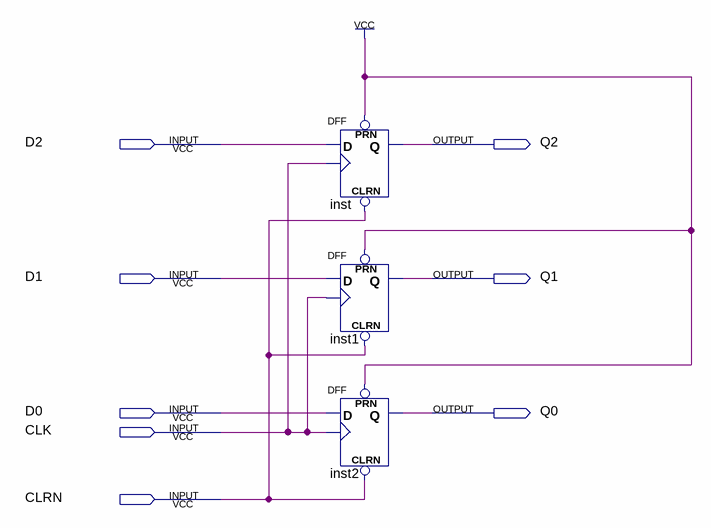
[diagram p0: schematic sheet]
// Quartus schematic block16.bdf as structural Verilog: 3 symbols, 8 pins
module block16 (
  input  D2,
  input  D1,
  input  D0,
  input  CLK,
  input  CLRN,
  output Q2,
  output Q1,
  output Q0
);

  DFF inst (.CLRN(CLRN), .CLK(CLK), .D(D2), .PRN(1'b1), .Q(Q2));
  DFF inst1 (.CLRN(CLRN), .CLK(CLK), .D(D1), .PRN(1'b1), .Q(Q1));
  DFF inst2 (.CLRN(CLRN), .CLK(CLK), .D(D0), .PRN(1'b1), .Q(Q0));
endmodule
